# Altium project LCD_adapter_board_for_FPGA_dev_board.PrjPcb
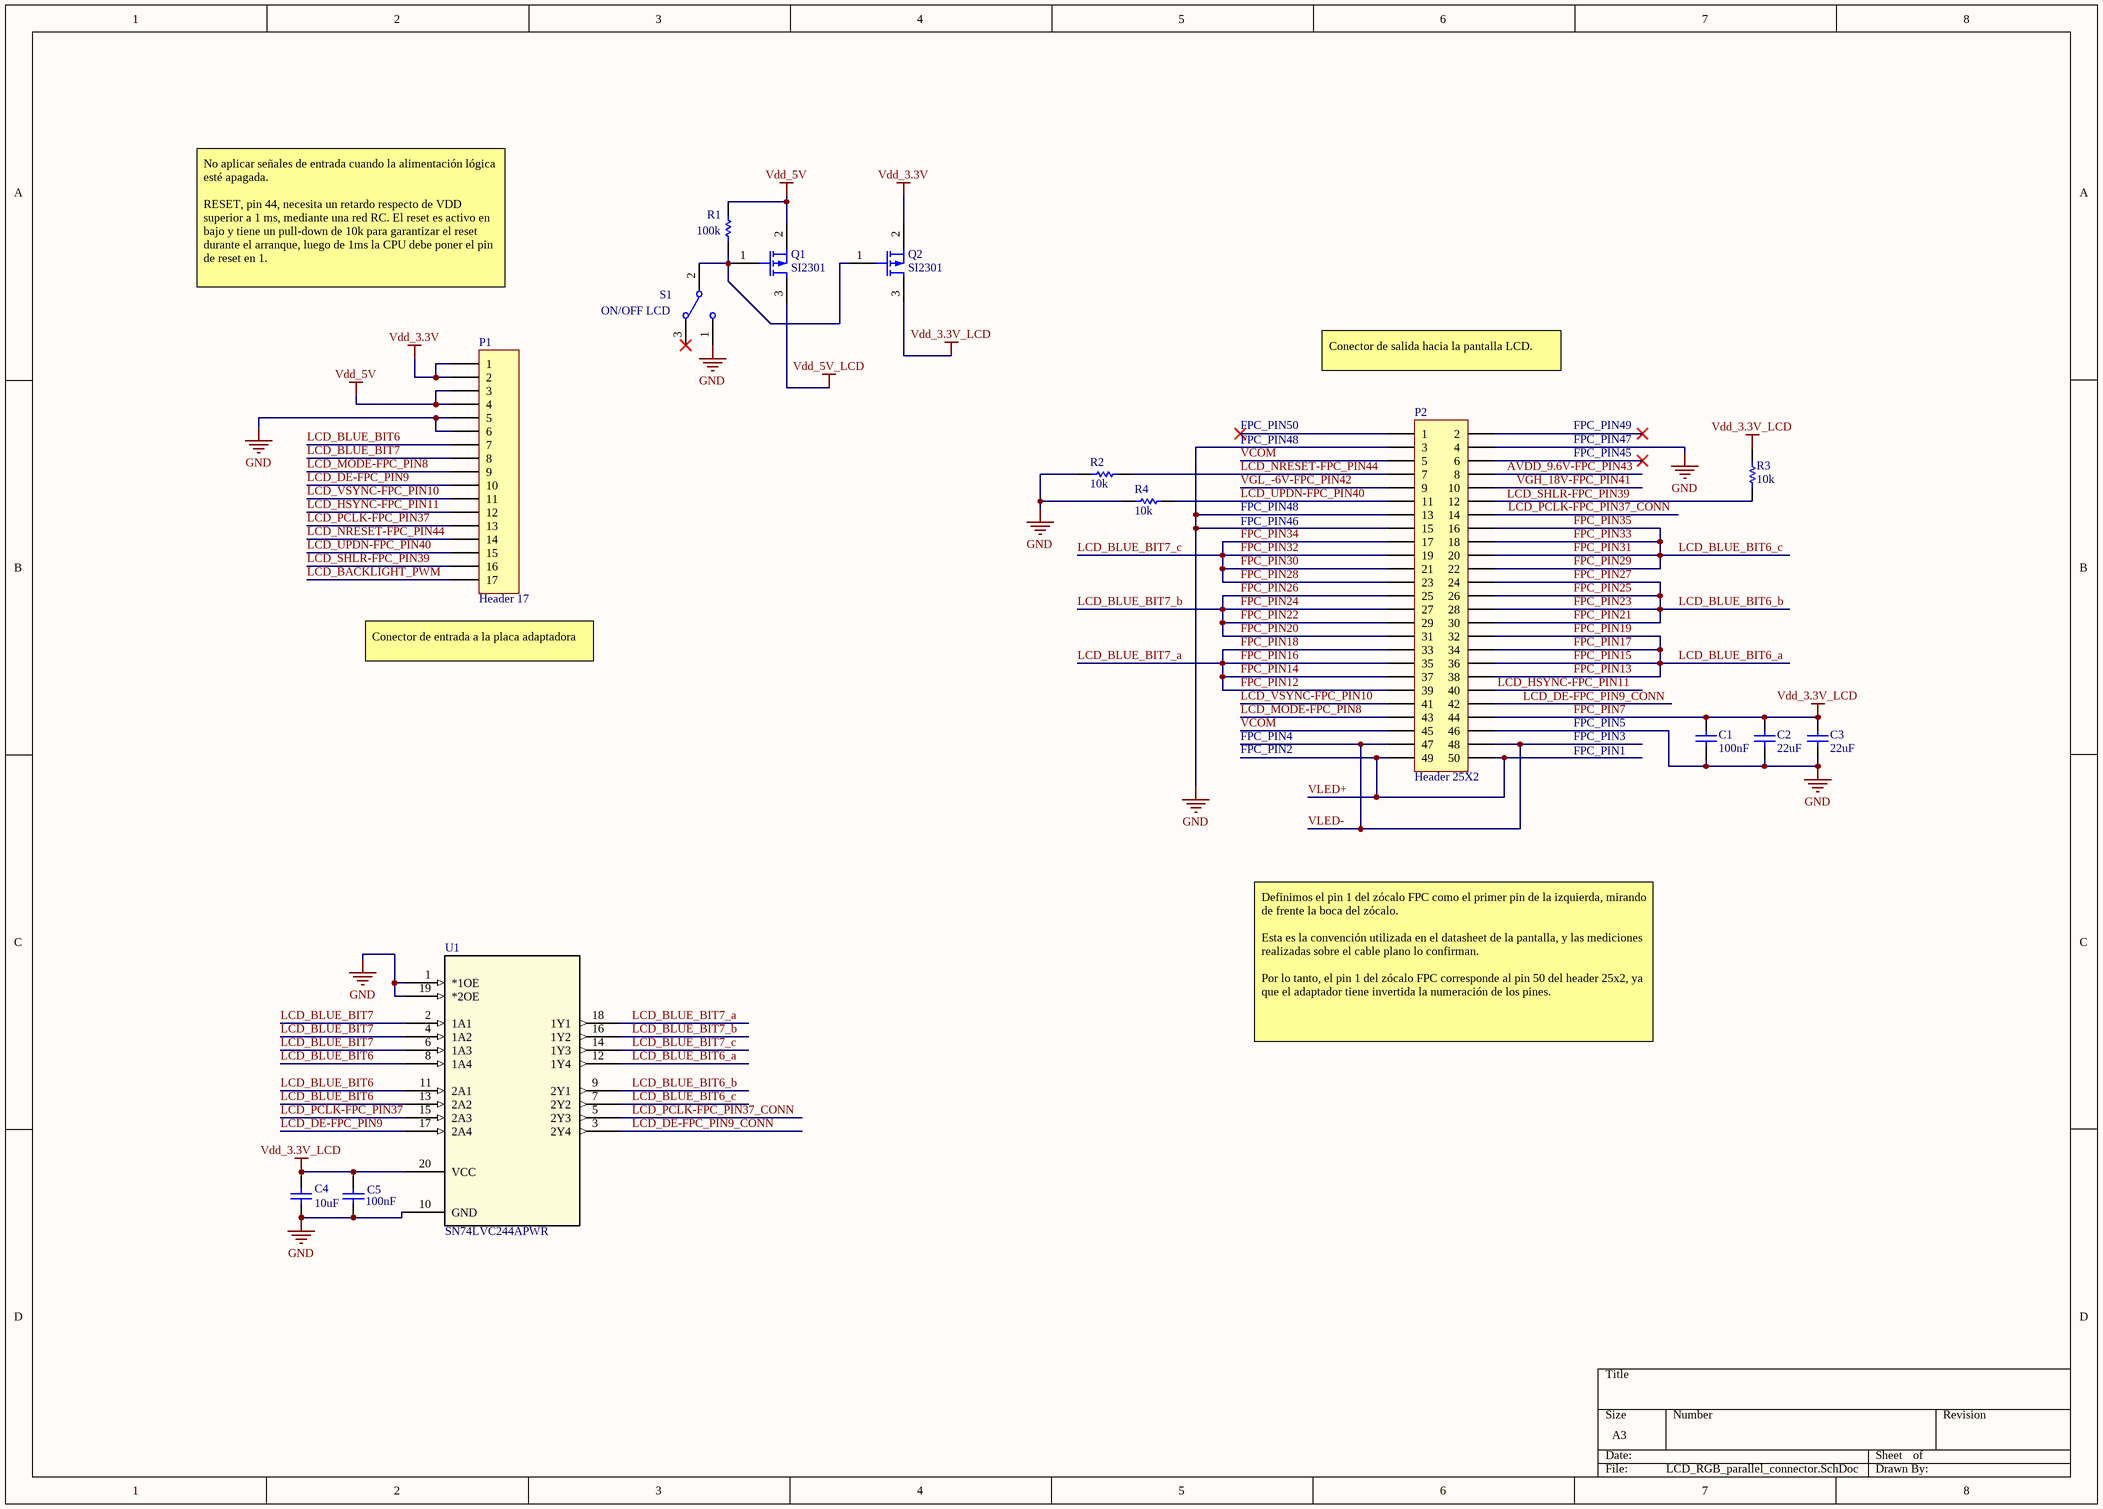
[diagram p0: LCD_RGB_parallel_connector.SchDoc]
3 sheets, 88 parts. Net scope: global (net labels, ports and power ports of the same name join across sheets).
Board file: PCB.PcbDoc
Sheets:
  LCD_RGB_parallel_connector.SchDoc
  LCD_backlight_power.SchDoc
  LCD_power_supplies.SchDoc

## Sheet LCD_RGB_parallel_connector.SchDoc
size A3; SheetNumber: 1; SheetTotal: 3

### Parts
C1  value 100nF  [capacitor 0805]  (hidden comment: ceramic capacitor)
C2  value 22uF  [capacitor 0805]  (hidden comment: ceramic capacitor)
C3  value 22uF  [capacitor 0805]  (hidden comment: ceramic capacitor)
C4  value 10uF  [capacitor 0603]  (hidden comment: ceramic capacitor)
C5  value 100nF  [capacitor 0603]  (hidden comment: Ceramic capacitor)
P1  Header 17  [HDR1X17]
P2  Header 25X2  [HDR2X25]
Q1  SI2301  [sot-23]
Q2  SI2301  [sot-23]
R1  value 100k  [resistor 0603]  (hidden comment: Resistor)
R2  value 10k  [resistor 0603]  (hidden comment: Resistor)
R3  value 10k  [resistor 0603]  (hidden comment: Resistor)
R4  value 10k  [resistor 0603]  (hidden comment: Resistor)
S1  SW-SPDT  [Slide switch 2mm pitch]  (value not drawn)
U1  SN74LVC244APWR  [PW20]

### Nets
FPC_PIN7: C1.1 C2.2 C3.2 C4.2 C5.2 P2.44 Q2.3(D) R3.1 U1.20(VCC)  [also labelled Vdd_3.3V_LCD]
GND: C1.2 C2.1 C3.1 C4.1 C5.1 P1.5 P1.6 P2.3 P2.4 P2.13 P2.15 P2.46 R2.2 R4.1 S1.1 U1.1(*1OE) U1.10(GND) U1.19(*2OE)
Vdd_3.3V: P1.1 P1.2 Q2.2(S)
Vdd_5V: P1.3 P1.4 Q1.2(S) R1.2
Vdd_5V_LCD: Q1.3(D)
AVDD_9.6V-FPC_PIN43: P2.8
FPC_PIN12: P2.33 P2.35 P2.37 P2.39 U1.18(1Y1)  [also labelled FPC_PIN14, FPC_PIN16, FPC_PIN18, LCD_BLUE_BIT7_a]
FPC_PIN13: P2.32 P2.34 P2.36 P2.38 U1.12(1Y4)  [also labelled FPC_PIN15, FPC_PIN17, FPC_PIN19, LCD_BLUE_BIT6_a]
FPC_PIN20: P2.25 P2.27 P2.29 P2.31 U1.16(1Y2)  [also labelled FPC_PIN22, FPC_PIN24, FPC_PIN26, LCD_BLUE_BIT7_b]
FPC_PIN21: P2.24 P2.26 P2.28 P2.30 U1.9(2Y1)  [also labelled FPC_PIN23, FPC_PIN25, FPC_PIN27, LCD_BLUE_BIT6_b]
FPC_PIN28: P2.17 P2.19 P2.21 P2.23 U1.14(1Y3)  [also labelled FPC_PIN30, FPC_PIN32, FPC_PIN34, LCD_BLUE_BIT7_c]
FPC_PIN29: P2.16 P2.18 P2.20 P2.22 U1.7(2Y2)  [also labelled FPC_PIN31, FPC_PIN33, FPC_PIN35, LCD_BLUE_BIT6_c]
LCD_BACKLIGHT_PWM: P1.17
LCD_BLUE_BIT6: P1.7 U1.8(1A4) U1.11(2A1) U1.13(2A2)
LCD_BLUE_BIT7: P1.8 U1.2(1A1) U1.4(1A2) U1.6(1A3)
LCD_DE-FPC_PIN9: P1.10 U1.17(2A4)
LCD_DE-FPC_PIN9_CONN: P2.42 U1.3(2Y4)
LCD_HSYNC-FPC_PIN11: P1.12 P2.40
LCD_MODE-FPC_PIN8: P1.9 P2.43
LCD_NRESET-FPC_PIN44: P1.14 P2.7 R2.1
LCD_PCLK-FPC_PIN37: P1.13 U1.15(2A3)
LCD_PCLK-FPC_PIN37_CONN: P2.14 U1.5(2Y3)
LCD_SHLR-FPC_PIN39: P1.16 P2.12 R3.2
LCD_UPDN-FPC_PIN40: P1.15 P2.11 R4.2
LCD_VSYNC-FPC_PIN10: P1.11 P2.41
VCOM: P2.5 P2.45
VGH_18V-FPC_PIN41: P2.10
VGL_-6V-FPC_PIN42: P2.9
VLED+: P2.49 P2.50
VLED-: P2.47 P2.48
NetQ1_1: Q1.1(G) Q2.1(G) R1.1 S1.2

Not connected (* = marked no-connect by the designer): P2 1* 2* 6*; S1 3*

### Notes on the sheet
- No aplicar señales de entrada cuando la alimentación lógica esté apagada.
  RESET, pin 44, necesita un retardo respecto de VDD superior a 1 ms, mediante una red RC. El reset es activo en bajo y tiene un pull-down de 10k para garantizar el reset durante el arranque, luego de 1ms la CPU debe poner el pin de reset en 1.
- (near S1) ON/OFF LCD
- Conector de salida hacia la pantalla LCD.
- FPC_PIN50
- FPC_PIN48
- FPC_PIN47
- FPC_PIN49
- FPC_PIN45
- FPC_PIN46
- (near P1) Conector de entrada a la placa adaptadora
- FPC_PIN2
- FPC_PIN4
- FPC_PIN1
- FPC_PIN3
- FPC_PIN5
- Definimos el pin 1 del zócalo FPC como el primer pin de la izquierda, mirando de frente la boca del zócalo.
  Esta es la convención utilizada en el datasheet de la pantalla, y las mediciones realizadas sobre el cable plano lo confirman.
  Por lo tanto, el pin 1 del zócalo FPC corresponde al pin 50 del header 25x2, ya que el adaptador tiene invertida la numeración de los pines.

### Library data of the parts
C1 = ceramic capacitor: Multilayer ceramic capacitor; V: 50; LCSC part: C1711; Package: 0805
C2 C3 = ceramic capacitor: Multilayer ceramic capacitor; V: 25; LCSC part: C45783; Package: 0805
C4 = ceramic capacitor: Multilayer ceramic capacitor; V: 6.3; LCSC part: C1691; Package: 0603
C5 = Ceramic capacitor: Multilayer ceramic capacitor; V: 50; LCSC part: C14663; Package: 0603
P1 = Header 17: Header, 17-Pin; LatestRevisionDate: 17-Jul-2002; LatestRevisionNote: Re-released for DXP Platform.; Publisher: Altium Limited
P2 = Header 25X2: Header, 25-Pin, Dual row; LatestRevisionDate: 17-Jul-2002; LatestRevisionNote: Re-released for DXP Platform.; Publisher: Altium Limited
Q1 Q2 = MOSFET-P: P-Channel MOSFET; MFR part: SI2301CDS-T1-GE3; MFR: Vishay Intertech; Package: SOT-23; LCSC part: C10487
S1 = SW-SPDT: SPDT Subminiature Toggle Switch, Right Angle Mounting, Vertical Actuation; pin to pad: 1>3 3>1; Published: 24-Mar-1999; LatestRevisionDate: 17-Dec-2003; LatestRevisionNote: Schematic revised, PCB Footprint replaced.; DatasheetVersion: 05-Dec-2000; PackageReference: TL36WW15050; Publisher: Altium Limited; PackageDescription: Switch; 4 Leads; ComponentLink1Description: Manufacturer Link; ComponentLink1URL: http://www.apem.com
U1 = SN74LVC244APWR: 8-ch, 1.65-V to 3.6-V buffers with 3-state outputs 20-TSSOP -40 to 125; Manufacturer_Name: Texas Instruments; Copyright: Copyright (C) 2026 Ultra Librarian. All rights reserved.; Manufacturer_Part_Number: SN74LVC244APWR; Datasheet: https://www.ti.com/lit/gpn/sn74lvc244a; RefDes: RefDes; Type: Type
R1-R4 = Resistor: Package: 0603

## Sheet LCD_backlight_power.SchDoc
size A3; SheetNumber: 2; SheetTotal: 3; SPICEModelCacheZVVUEIQZ: <root> / <DocumentId>ZVVUEIQZ</DocumentId> / <CacheFrame Number="0"> / <Model Name="skydiode" Kind="MDL"> / <Text>*Default Schottky Diode / *Schottky Diode Pinout: A,K / .MODEL SKYDIODE D(EG=0.69 XTI=2)</Text> / </Model> / </CacheFrame> / </root>
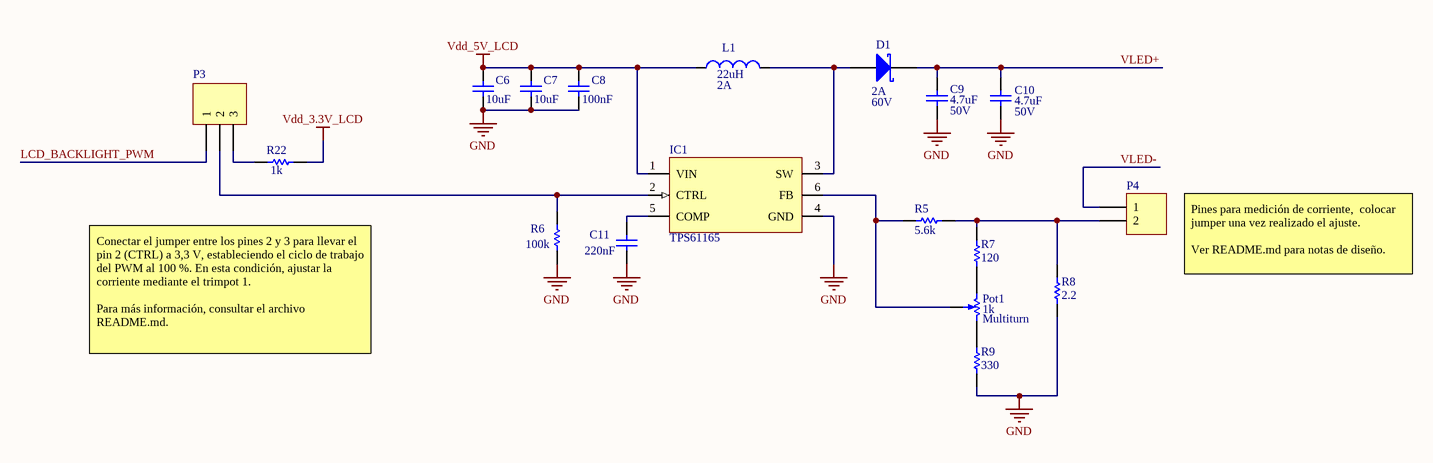
[diagram p1: LCD_backlight_power.SchDoc]

### Parts
C6  value 10uF  [capacitor 0805]  (hidden comment: ceramic capacitor)
C7  value 10uF  [capacitor 0805]  (hidden comment: ceramic capacitor)
C8  value 100nF  [capacitor 0805]  (hidden comment: ceramic capacitor)
C9  value 4.7uF  V: 50V  [capacitor 1206]  (hidden comment: ceramic capacitor)
C10  value 4.7uF  V: 50V  [capacitor 1206]  (hidden comment: ceramic capacitor)
C11  value 220nF  [capacitor 0805]  (hidden comment: ceramic capacitor)
D1  current: 2A  voltage: 60V  [DO-214AC]  (hidden comment: D Schottky)
IC1  TPS61165  [sot-23 (6)]
L1  value 22uH  Irms: 2A  [Inductor SMD 6.6 x 7.3 x 4]  (hidden comment: Inductor)
P3  Header 3  [HDR1X3]  (value not drawn)
P4  Header 2  [HDR1X2]  (value not drawn)
Pot1  Multiturn  value 1k  [trim pot 3296W]
R5  value 5.6k  [resistor 0603]  (hidden comment: Resistor)
R6  value 100k  [resistor 0603]  (hidden comment: Resistor)
R7  value 120  [resistor 0805]  (hidden comment: Resistor)
R8  value 2.2  [resistor 2512]  (hidden comment: Resistor)
R9  value 330  [resistor 0805]  (hidden comment: Resistor)
R22  value 1k  [resistor 0603]  (hidden comment: Resistor)

### Nets
GND: C6.2 C7.2 C8.2 C9.2 C10.2 C11.2 IC1.4(GND) R6.2 R8.1 R9.2
Vdd_3.3V_LCD: R22.2  [project net FPC_PIN7]
Vdd_5V_LCD: C6.1 C7.1 C8.1 IC1.1(VIN) L1.1
LCD_BACKLIGHT_PWM: P3.1
VLED+: C9.1 C10.1 D1.2(K)
VLED-: P4.1
NetC11_1: C11.1 IC1.5(COMP)
NetD1_1: D1.1(A) IC1.3(SW) L1.2
NetIC1_2: IC1.2(CTRL) P3.2 R6.1
NetIC1_6: IC1.6(FB) Pot1.W R5.2
NetP3_3: P3.3 R22.1
NetP4_2: P4.2 R5.1 R7.1 R8.2
NetPot1_CCW: Pot1.CCW(-) R9.1
NetPot1_CW: Pot1.CW(+) R7.2

### Notes on the sheet
- Pines para medición de corriente,  colocar jumper una vez realizado el ajuste.
  Ver README.md para notas de diseño.
- Conectar el jumper entre los pines 2 y 3 para llevar el pin 2 (CTRL) a 3,3 V, estableciendo el ciclo de trabajo del PWM al 100 %. En esta condición, ajustar la corriente mediante el trimpot 1.
  Para más información, consultar el archivo README.md.

### Library data of the parts
C6 C7 = ceramic capacitor: Multilayer ceramic capacitor; V: 25; Material: X5R; LCSC part: C15850; Package: 0805
C8 = ceramic capacitor: Multilayer ceramic capacitor; V: 50; Material: X7R; LCSC part: C1711; Package: 0805
C9 C10 = ceramic capacitor: Multilayer ceramic capacitor; Material: X7R; LCSC part: C51205; Package: 1206
C11 = ceramic capacitor: Multilayer ceramic capacitor; V: 25; Material: X7R; LCSC part: C5153; Package: 0805
D1 = D Schottky: Schottky Diode; MFR: Vishay Intertech; MFR part: SS26SHE3_B/H; LCSC part: C511359; Package: SMA(DO-214AC)
IC1 = TPS61165: LED Backlighting for LCD display; MFR: Texas Instruments; MFR part: TPS61165DBVR; LCSC part: C58756; Package: SOT-23-6
L1 = Inductor: MFR: YOUCHI; MFR part: HCMA-0630-220-M-K; Isat: 2.5A; Max. DC Resistance: 190mOhm; LCSC part: C54431705; Package: SMD,7.3x6.6mm
P3 = Header 3: Header, 3-Pin; LatestRevisionDate: 17-Jul-2002; LatestRevisionNote: Re-released for DXP Platform.; Publisher: Altium Limited
P4 = Header 2: Header, 2-Pin; LatestRevisionDate: 17-Jul-2002; LatestRevisionNote: Re-released for DXP Platform.; Publisher: Altium Limited
Pot1 = RPot SM: Square Trimming Potentiometer; pin to pad: CCW>3 CW>1 W>2; ComponentLink1Description: Manufacturer Link; ComponentLink1URL: http://bourns.com/2/search.html
R5-R9 R22 = Resistor
  R5 R6 R22: Package: 0603
  R7 R9: Package: 0805
  R8: LCSC part: C55586149; Package: 2512

## Sheet LCD_power_supplies.SchDoc
size A3; SheetNumber: 3; SheetTotal: 3; SPICEModelCacheFLKPPTFO: <root> / <DocumentId>FLKPPTFO</DocumentId> / <CacheFrame Number="0"> / <Model Name="skydiode" Kind="MDL"> / <Text>*Default Schottky Diode / *Schottky Diode Pinout: A,K / .MODEL SKYDIODE D(EG=0.69 XTI=2)</Text> / </Model> / </CacheFrame> / </root>
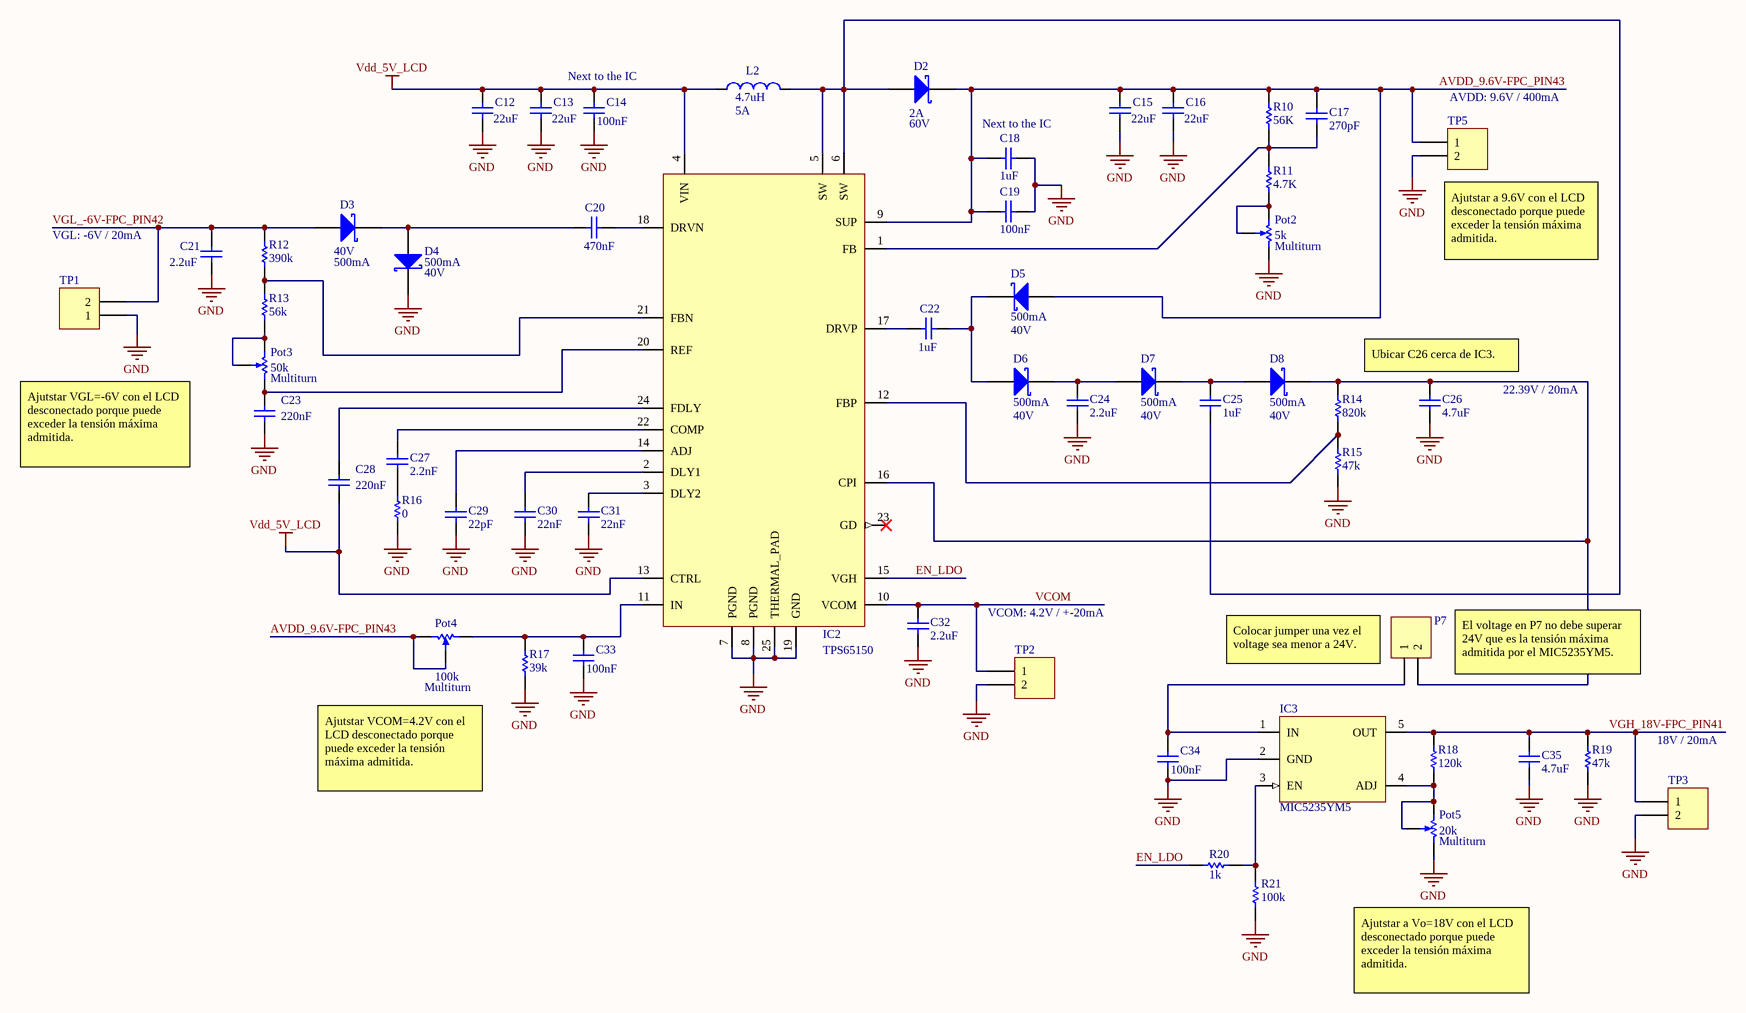
[diagram p2: LCD_power_supplies.SchDoc]

### Parts
C12  value 22uF  [capacitor 0805]  (hidden comment: ceramic capacitor)
C13  value 22uF  [capacitor 0805]  (hidden comment: ceramic capacitor)
C14  value 100nF  [capacitor 0805]  (hidden comment: ceramic capacitor)
C15  value 22uF  [capacitor 0805]  (hidden comment: ceramic capacitor)
C16  value 22uF  [capacitor 0805]  (hidden comment: ceramic capacitor)
C17  value 270pF  [capacitor 0603]  (hidden comment: ceramic capacitor)
C18  value 1uF  [capacitor 0603]  (hidden comment: ceramic capacitor)
C19  value 100nF  [capacitor 0603]  (hidden comment: ceramic capacitor)
C20  value 470nF  [capacitor 0603]  (hidden comment: ceramic capacitor)
C21  value 2.2uF  [capacitor 0603]  (hidden comment: ceramic capacitor)
C22  value 1uF  [capacitor 0805]  (hidden comment: ceramic capacitor)
C23  value 220nF  [capacitor 0805]  (hidden comment: ceramic capacitor)
C24  value 2.2uF  [capacitor 0805]  (hidden comment: ceramic capacitor)
C25  value 1uF  [capacitor 0805]  (hidden comment: ceramic capacitor)
C26  value 4.7uF  [capacitor 1206]  (hidden comment: ceramic capacitor)
C27  value 2.2nF  [capacitor 0603]  (hidden comment: ceramic capacitor)
C28  value 220nF  [capacitor 0805]  (hidden comment: ceramic capacitor)
C29  value 22pF  [capacitor 0603]  (hidden comment: ceramic capacitor)
C30  value 22nF  [capacitor 0603]  (hidden comment: ceramic capacitor)
C31  value 22nF  [capacitor 0603]  (hidden comment: ceramic capacitor)
C32  value 2.2uF  [capacitor 0603]  (hidden comment: ceramic capacitor)
C33  value 100nF  [capacitor 0603]  (hidden comment: ceramic capacitor)
C34  value 100nF  [capacitor 0603]  (hidden comment: ceramic capacitor)
C35  value 4.7uF  [capacitor 1206]  (hidden comment: ceramic capacitor)
D2  current: 2A  voltage: 60V  [DO-214AC]  (hidden comment: D Schottky)
D3  current: 500mA  voltage: 40V  [SOD123]  (hidden comment: D Schottky)
D4  current: 500mA  voltage: 40V  [SOD123]  (hidden comment: D Schottky)
D5  current: 500mA  voltage: 40V  [SOD123]  (hidden comment: D Schottky)
D6  current: 500mA  voltage: 40V  [SOD123]  (hidden comment: D Schottky)
D7  current: 500mA  voltage: 40V  [SOD123]  (hidden comment: D Schottky)
D8  current: 500mA  voltage: 40V  [SOD123]  (hidden comment: D Schottky)
IC2  TPS65150  [TSSOP24-Thermal_pad]
IC3  MIC5235YM5  [sot-23 (5)]
L2  value 4.7uH  Irms: 5A  [Inductor SMD 6.6 x 7.1 x 3]  (hidden comment: Inductor)
P7  Header 2  [HDR1X2]  (value not drawn)
Pot2  Multiturn  value 5k  [trim pot 3296W]
Pot3  Multiturn  value 50k  [trim pot 3296W]
Pot4  Multiturn  value 100k  [trim pot 3296W]
Pot5  Multiturn  value 20k  [trim pot 3296W]
R10  value 56K  [resistor 0603]  (hidden comment: Resistor)
R11  value 4.7K  [resistor 0603]  (hidden comment: Resistor)
R12  value 390k  [resistor 0603]  (hidden comment: Resistor)
R13  value 56k  [resistor 0603]  (hidden comment: Resistor)
R14  value 820k  [resistor 0603]  (hidden comment: Resistor)
R15  value 47k  [resistor 0603]  (hidden comment: Resistor)
R16  value 0  [resistor 0603]  (hidden comment: Resistor)
R17  value 39k  [resistor 0603]  (hidden comment: Resistor)
R18  value 120k  [resistor 0603]  (hidden comment: Resistor)
R19  value 47k  [resistor 0603]  (hidden comment: Resistor)
R20  value 1k  [resistor 0603]  (hidden comment: Resistor)
R21  value 100k  [resistor 0603]  (hidden comment: Resistor)
TP1  Header 2  [HDR1X2]  (value not drawn)
TP2  Header 2  [HDR1X2]  (value not drawn)
TP3  Header 2  [HDR1X2]  (value not drawn)
TP5  Header 2  [HDR1X2]  (value not drawn)

### Nets
GND: C12.2 C13.2 C14.2 C15.2 C16.2 C18.2 C19.2 C21.2 C23.2 C24.1 C26.1 C29.2 C30.1 C31.1 C32.1 C33.2 C34.2 C35.1 D4.2(K) IC2.7(PGND) IC2.8(PGND) IC2.19(GND) IC2.25(THERMAL_PAD) IC3.2(GND) Pot2.CCW(-) Pot5.CCW(-) R15.2 R16.2 R17.1 R19.1 R21.1 TP1.1 TP2.2 TP3.2 TP5.2
Vdd_5V_LCD: C12.1 C13.1 C14.1 C28.2 IC2.4(VIN) IC2.13(CTRL) L2.1
AVDD_9.6V-FPC_PIN43: C15.1 C16.1 C17.2 C18.1 C19.1 D2.2(K) D5.1(A) IC2.9(SUP) Pot4.CW(+) Pot4.W R10.1 TP5.1
EN_LDO: IC2.15(VGH) R20.1
VCOM: C32.2 IC2.10(VCOM) TP2.1
VGH_18V-FPC_PIN41: C35.2 IC3.5(OUT) R18.2 R19.2 TP3.1
VGL_-6V-FPC_PIN42: C21.1 D3.1(A) R12.1 TP1.2
NetC17_1: C17.1 IC2.1(FB) R10.2 R11.1
NetC20_1: C20.1 IC2.18(DRVN)
NetC20_2: C20.2 D3.2(K) D4.1(A)
NetC22_1: C22.1 D5.2(K) D6.1(A)
NetC22_2: C22.2 IC2.17(DRVP)
NetC23_1: C23.1 IC2.20(REF) Pot3.CCW(-)
NetC24_2: C24.2 D6.2(K) D7.1(A)
NetC25_1: C25.1 D7.2(K) D8.1(A)
NetC25_2: C25.2 D2.1(A) IC2.5(SW) IC2.6(SW) L2.2
NetC26_2: C26.2 D8.2(K) IC2.16(CPI) P7.2 R14.1
NetC27_1: C27.1 IC2.22(COMP)
NetC27_2: C27.2 R16.1
NetC28_1: C28.1 IC2.24(FDLY)
NetC29_1: C29.1 IC2.14(ADJ)
NetC30_2: C30.2 IC2.2(DLY1)
NetC31_2: C31.2 IC2.3(DLY2)
NetC33_1: C33.1 IC2.11(IN) Pot4.CCW(-) R17.2
NetC34_1: C34.1 IC3.1(IN) P7.1
NetIC2_12: IC2.12(FBP) R14.2 R15.1
NetIC2_21: IC2.21(FBN) R12.2 R13.1
NetIC3_3: IC3.3(EN) R20.2 R21.2
NetIC3_4: IC3.4(ADJ) Pot5.CW(+) Pot5.W R18.1
NetPot2_CW: Pot2.CW(+) Pot2.W R11.2
NetPot3_CW: Pot3.CW(+) Pot3.W R13.2

Not connected (* = marked no-connect by the designer): IC2 23(GD)*

### Notes on the sheet
- (near C14) Next to the IC
- (near TP5) AVDD: 9.6V / 400mA
- (near C18) Next to the IC
- VGL: -6V / 20mA
- (near TP5) Ajutstar a 9.6V con el LCD desconectado porque puede exceder la tensión máxima admitida.
- Ubicar C26 cerca de IC3.
- 22.39V / 20mA
- Ajutstar VGL=-6V con el LCD desconectado porque puede exceder la tensión máxima admitida.
- VCOM: 4.2V / +-20mA
- (near P7) Colocar jumper una vez el voltage sea menor a 24V.
- (near P7) El voltage en P7 no debe superar 24V que es la tensión máxima admitida por el MIC5235YM5.
- Ajutstar VCOM=4.2V con el LCD desconectado porque puede exceder la tensión máxima admitida.
- 18V / 20mA
- Ajutstar a Vo=18V con el LCD desconectado porque puede exceder la tensión máxima admitida.

### Library data of the parts
C12 C13 C15 C16 = ceramic capacitor: as C6 on sheet LCD_backlight_power; LCSC part: C602037; Package: 0805
C14 C19 C33 C34 = ceramic capacitor: as C8 on sheet LCD_backlight_power
  C14: LCSC part: C1711; Package: 0805
  C19 C33 C34: LCSC part: C1591; Package: 0603
C17 C27 C29 = ceramic capacitor: Multilayer ceramic capacitor; V: 50V; Material: C0G; Package: 0603
  C17: LCSC part: C472789
  C27: LCSC part: C343869
  C29: LCSC part: C1653
C18 = ceramic capacitor: as C11 on sheet LCD_backlight_power; LCSC part: C29936; Package: 0603
C20 C23 C28 = ceramic capacitor: Multilayer ceramic capacitor; V: 25V; Material: X7R
  C20: LCSC part: C472773; Package: 0603
  C23 C28: LCSC part: C5153; Package: 0805
C21 C32 = ceramic capacitor: Multilayer ceramic capacitor; V: 25V; Material: X5R; LCSC part: C57895; Package: 0603
C22 C24-C26 C30 C31 C35 = ceramic capacitor: Multilayer ceramic capacitor; V: 50V; Material: X7R
  C22 C25: LCSC part: C77083; Package: 0805
  C24: LCSC part: C2762602; Package: 0805
  C26 C35: LCSC part: C307575; Package: 1206
  C30 C31: LCSC part: C21122; Package: 0603
D2 = D Schottky: as D1 on sheet LCD_backlight_power; LCSC part: C511359; Package: SMA(DO-214AC)
D3-D8 = D Schottky: Schottky Diode; MFR: onsemi; MFR part: MBR0540T1G; LCSC part: C21353; Package: SOD-123
IC2 = TPS65150: LCD Power Supply
IC3 = MIC5235YM5: Ultra-Low Quiescent Current, 150mA μCap LDO Regulator.
L2 = Inductor: MFR: Magnetsyc; MFR part: FSA0630-4R7MT; Isat: 7.2A; Max. DC Resistance: 33mOhm; LCSC part: C41384284; Package: SMD,7x6.6mm
P7 TP1-TP3 TP5 = Header 2: Header, 2-Pin; LatestRevisionDate: 17-Jul-2002; LatestRevisionNote: Re-released for DXP Platform.; Publisher: Altium Limited
Pot2-Pot5 = RPot SM: Square Trimming Potentiometer; pin to pad: CCW>1 CW>2 W>3; ComponentLink1Description: Manufacturer Link; ComponentLink1URL: http://bourns.com/2/search.html
R10-R21 = Resistor: Package: 0603

## Nets that join several sheets
FPC_PIN7: LCD_RGB_parallel_connector (9 pins), LCD_backlight_power (R22.2)
GND: LCD_RGB_parallel_connector (18 pins), LCD_backlight_power (10 pins), LCD_power_supplies (35 pins)
Vdd_5V_LCD: LCD_RGB_parallel_connector (Q1.3), LCD_backlight_power (5 pins), LCD_power_supplies (7 pins)
AVDD_9.6V-FPC_PIN43: LCD_RGB_parallel_connector (P2.8), LCD_power_supplies (12 pins)
LCD_BACKLIGHT_PWM: LCD_RGB_parallel_connector (P1.17), LCD_backlight_power (P3.1)
VCOM: LCD_RGB_parallel_connector (P2.5 P2.45), LCD_power_supplies (C32.2 IC2.10 TP2.1)
VGH_18V-FPC_PIN41: LCD_RGB_parallel_connector (P2.10), LCD_power_supplies (5 pins)
VGL_-6V-FPC_PIN42: LCD_RGB_parallel_connector (P2.9), LCD_power_supplies (C21.1 D3.1 R12.1 TP1.2)
VLED+: LCD_RGB_parallel_connector (P2.49 P2.50), LCD_backlight_power (C9.1 C10.1 D1.2)
VLED-: LCD_RGB_parallel_connector (P2.47 P2.48), LCD_backlight_power (P4.1)